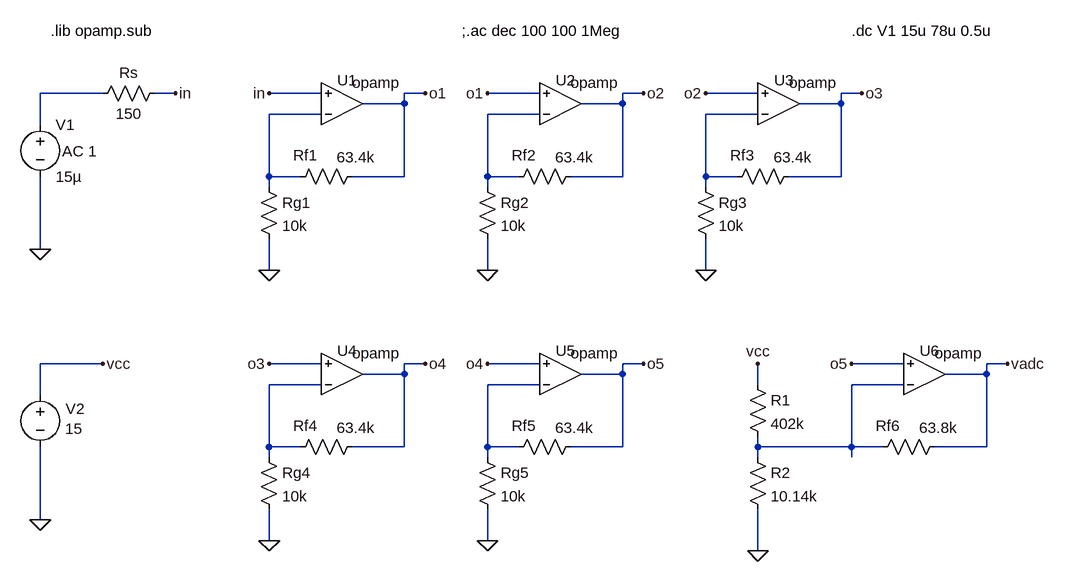
[diagram p0: schematic acondicionamiento.asc]
acondicionamiento.asc, the LTspice schematic file:
Version 4.1
SHEET 1 1900 760
WIRE -1008 -144 -1104 -144
WIRE -896 -144 -928 -144
WIRE -672 -144 -752 -144
WIRE -512 -144 -544 -144
WIRE -336 -144 -416 -144
WIRE -176 -144 -208 -144
WIRE 0 -144 -80 -144
WIRE 160 -144 128 -144
WIRE -544 -128 -544 -144
WIRE -544 -128 -608 -128
WIRE -208 -128 -208 -144
WIRE -208 -128 -272 -128
WIRE 128 -128 128 -144
WIRE 128 -128 64 -128
WIRE -672 -112 -752 -112
WIRE -336 -112 -416 -112
WIRE 0 -112 -80 -112
WIRE -1104 -96 -1104 -144
WIRE -752 -16 -752 -112
WIRE -704 -16 -752 -16
WIRE -544 -16 -544 -128
WIRE -544 -16 -624 -16
WIRE -416 -16 -416 -112
WIRE -368 -16 -416 -16
WIRE -208 -16 -208 -128
WIRE -208 -16 -288 -16
WIRE -80 -16 -80 -112
WIRE -32 -16 -80 -16
WIRE 128 -16 128 -128
WIRE 128 -16 48 -16
WIRE -752 0 -752 -16
WIRE -416 0 -416 -16
WIRE -80 0 -80 -16
WIRE -1104 96 -1104 -16
WIRE -752 128 -752 80
WIRE -416 128 -416 80
WIRE -80 128 -80 80
WIRE -1008 272 -1104 272
WIRE -672 272 -752 272
WIRE -512 272 -544 272
WIRE -336 272 -416 272
WIRE -176 272 -208 272
WIRE 224 272 144 272
WIRE 384 272 352 272
WIRE -544 288 -544 272
WIRE -544 288 -608 288
WIRE -208 288 -208 272
WIRE -208 288 -272 288
WIRE 352 288 352 272
WIRE 352 288 288 288
WIRE -672 304 -752 304
WIRE -336 304 -416 304
WIRE 0 304 0 272
WIRE 224 304 144 304
WIRE -1104 320 -1104 272
WIRE -752 400 -752 304
WIRE -704 400 -752 400
WIRE -544 400 -544 288
WIRE -544 400 -624 400
WIRE -416 400 -416 304
WIRE -368 400 -416 400
WIRE -208 400 -208 288
WIRE -208 400 -288 400
WIRE 0 400 0 384
WIRE 144 400 144 304
WIRE 144 400 0 400
WIRE 192 400 144 400
WIRE 352 400 352 288
WIRE 352 400 272 400
WIRE -752 416 -752 400
WIRE -416 416 -416 400
WIRE 0 416 0 400
WIRE 144 416 144 400
WIRE -1104 512 -1104 400
WIRE -752 544 -752 496
WIRE -416 544 -416 496
WIRE 0 560 0 496
FLAG -1104 96 0
FLAG -896 -144 in
FLAG -752 -144 in
FLAG -752 128 0
FLAG -512 -144 o1
FLAG -416 -144 o1
FLAG -416 128 0
FLAG -176 -144 o2
FLAG -80 -144 o2
FLAG -80 128 0
FLAG 160 -144 o3
FLAG -752 272 o3
FLAG -752 544 0
FLAG -512 272 o4
FLAG -416 272 o4
FLAG -416 544 0
FLAG -176 272 o5
FLAG 144 272 o5
FLAG 384 272 vadc
FLAG 0 560 0
FLAG 0 272 vcc
FLAG -1104 512 0
FLAG -1008 272 vcc
SYMBOL voltage -1104 -112 R0
WINDOW 123 34 57 Left 2
WINDOW 39 0 0 Left 0
SYMATTR Value2 AC 1
SYMATTR InstName V1
SYMATTR Value 15µ
SYMBOL res -912 -160 R90
WINDOW 0 0 56 VBottom 2
WINDOW 3 32 56 VTop 2
SYMATTR InstName Rs
SYMATTR Value 150
SYMBOL OpAmps\\opamp -640 -64 M180
WINDOW 0 -7 100 Left 2
SYMATTR InstName U1
SYMATTR SpiceLine Aol=1Meg
SYMATTR SpiceLine2 GBW=100k
SYMBOL res -768 -16 R0
SYMATTR InstName Rg1
SYMATTR Value 10k
SYMBOL res -608 -32 R90
WINDOW 0 -1 88 VBottom 2
WINDOW 3 -29 10 VTop 2
SYMATTR InstName Rf1
SYMATTR Value 63.4k
SYMBOL res -432 -16 R0
SYMATTR InstName Rg2
SYMATTR Value 10k
SYMBOL res -272 -32 R90
WINDOW 0 -1 88 VBottom 2
WINDOW 3 -29 10 VTop 2
SYMATTR InstName Rf2
SYMATTR Value 63.4k
SYMBOL res -96 -16 R0
SYMATTR InstName Rg3
SYMATTR Value 10k
SYMBOL res 64 -32 R90
WINDOW 0 -1 88 VBottom 2
WINDOW 3 -29 10 VTop 2
SYMATTR InstName Rf3
SYMATTR Value 63.4k
SYMBOL OpAmps\\opamp -304 -64 M180
WINDOW 0 -7 100 Left 2
SYMATTR InstName U2
SYMATTR SpiceLine Aol=1Meg
SYMATTR SpiceLine2 GBW=100k
SYMBOL OpAmps\\opamp 32 -64 M180
WINDOW 0 -7 100 Left 2
SYMATTR InstName U3
SYMATTR SpiceLine Aol=1Meg
SYMATTR SpiceLine2 GBW=100k
SYMBOL OpAmps\\opamp -640 352 M180
WINDOW 0 -7 100 Left 2
SYMATTR InstName U4
SYMATTR SpiceLine Aol=1Meg
SYMATTR SpiceLine2 GBW=100k
SYMBOL res -768 400 R0
SYMATTR InstName Rg4
SYMATTR Value 10k
SYMBOL res -608 384 R90
WINDOW 0 -1 88 VBottom 2
WINDOW 3 -29 10 VTop 2
SYMATTR InstName Rf4
SYMATTR Value 63.4k
SYMBOL res -432 400 R0
SYMATTR InstName Rg5
SYMATTR Value 10k
SYMBOL res -272 384 R90
WINDOW 0 -1 88 VBottom 2
WINDOW 3 -29 10 VTop 2
SYMATTR InstName Rf5
SYMATTR Value 63.4k
SYMBOL OpAmps\\opamp -304 352 M180
WINDOW 0 -7 100 Left 2
SYMATTR InstName U5
SYMATTR SpiceLine Aol=1Meg
SYMATTR SpiceLine2 GBW=100k
SYMBOL res 288 384 R90
WINDOW 0 -1 88 VBottom 2
WINDOW 3 -29 10 VTop 2
SYMATTR InstName Rf6
SYMATTR Value 63.8k
SYMBOL OpAmps\\opamp 256 352 M180
WINDOW 0 -7 100 Left 2
SYMATTR InstName U6
SYMATTR SpiceLine Aol=1Meg
SYMATTR SpiceLine2 GBW=100k
SYMBOL res -16 288 R0
SYMATTR InstName R1
SYMATTR Value 402k
SYMBOL res -16 400 R0
SYMATTR InstName R2
SYMATTR Value 10.14k
SYMBOL voltage -1104 304 R0
WINDOW 0 39 37 Left 2
WINDOW 3 38 68 Left 2
WINDOW 123 34 57 Left 2
WINDOW 39 0 0 Left 0
SYMATTR InstName V2
SYMATTR Value 15
TEXT -1088 -240 Left 2 !.lib opamp.sub
TEXT -456 -240 Left 2 !;.ac dec 100 100 1Meg
TEXT 144 -240 Left 2 !.dc V1 15u 78u 0.5u

The netlist it stands for:
* acondicionamiento.asc
V1 N001 0 15µ AC 1
Rs in N001 150
X§U1 N002 in o1 opamp Aol=1Meg GBW=100k  ; pins invin noninvin out
Rg1 N002 0 10k
Rf1 o1 N002 63.4k
Rg2 N003 0 10k
Rf2 o2 N003 63.4k
Rg3 N004 0 10k
Rf3 o3 N004 63.4k
X§U2 N003 o1 o2 opamp Aol=1Meg GBW=100k  ; pins invin noninvin out
X§U3 N004 o2 o3 opamp Aol=1Meg GBW=100k  ; pins invin noninvin out
X§U4 N005 o3 o4 opamp Aol=1Meg GBW=100k  ; pins invin noninvin out
Rg4 N005 0 10k
Rf4 o4 N005 63.4k
Rg5 N006 0 10k
Rf5 o5 N006 63.4k
X§U5 N006 o4 o5 opamp Aol=1Meg GBW=100k  ; pins invin noninvin out
Rf6 vadc N007 63.8k
X§U6 N007 o5 vadc opamp Aol=1Meg GBW=100k  ; pins invin noninvin out
R1 vcc N007 402k
R2 N007 0 10.14k
V2 vcc 0 15
.lib opamp.sub
;.ac dec 100 100 1Meg
.dc V1 15u 78u 0.5u
.backanno
.end

* Results of the author's LTspice run, read from the files saved beside the schematic
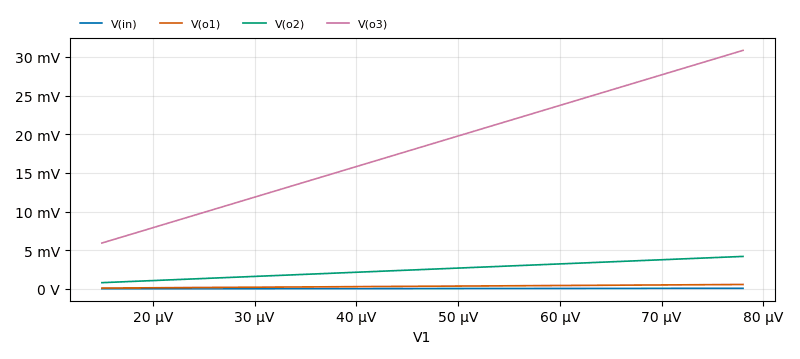
[diagram p1: DC transfer characteristic of acondicionamiento.asc, plotted from the saved traces]
* DC transfer characteristic, 1 run:
*   V(in): 15 µV at V1=15 µV, 78 µV at V1=78 µV, min 15 µV, max 78 µV
*   V(o1): 110.1 µV at V1=15 µV, 572.5 µV at V1=78 µV, min 110.1 µV, max 572.5 µV
*   V(o2): 808.1 µV at V1=15 µV, 4.202 mV at V1=78 µV, min 808.1 µV, max 4.202 mV
*   V(o3): 5.932 mV at V1=15 µV, 30.84 mV at V1=78 µV, min 5.932 mV, max 30.84 mV